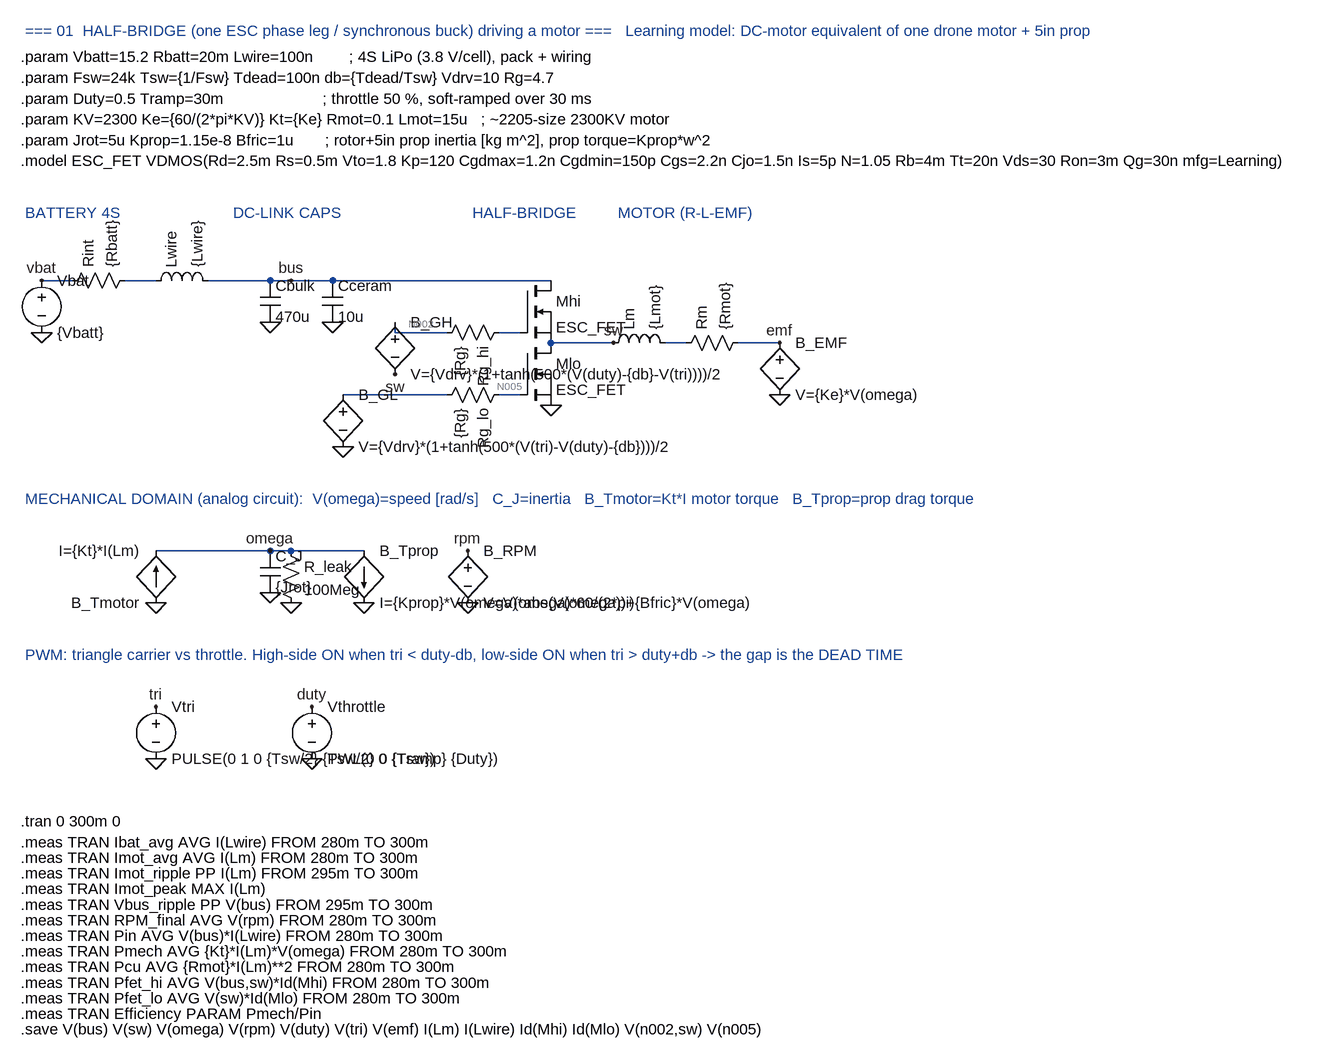
[diagram p0: schematic HalfBridge_MotorDrive.asc]
HalfBridge_MotorDrive.asc, the LTspice schematic file:
Version 4
SHEET 1 1600 1100
WIRE 64 144 112 144
WIRE 192 144 240 144
WIRE 320 144 848 144
WIRE 608 208 608 224
WIRE 608 224 688 224
WIRE 768 224 800 224
WIRE 528 320 688 320
WIRE 768 320 800 320
WIRE 848 240 944 240
WIRE 1024 240 1056 240
WIRE 1136 240 1200 240
WIRE 240 560 560 560
FLAG 64 224 0
FLAG 416 208 0
FLAG 512 208 0
FLAG 848 336 0
FLAG 1200 320 0
FLAG 608 288 sw
FLAG 528 400 0
FLAG 944 240 sw
FLAG 448 144 bus
FLAG 64 144 vbat
FLAG 416 624 0
FLAG 240 640 0
FLAG 560 640 0
FLAG 720 640 0
FLAG 416 560 omega
FLAG 720 560 rpm
FLAG 240 880 0
FLAG 240 800 tri
FLAG 480 880 0
FLAG 480 800 duty
FLAG 1200 240 emf
FLAG 448 640 0
SYMBOL voltage 64 128 R0
SYMATTR InstName Vbat
SYMATTR Value {Vbatt}
SYMBOL res 96 160 R270
SYMATTR InstName Rint
SYMATTR Value {Rbatt}
SYMBOL ind 224 160 R270
SYMATTR InstName Lwire
SYMATTR Value {Lwire}
SYMATTR SpiceLine Rser=2m
SYMBOL cap 400 144 R0
SYMATTR InstName Cbulk
SYMATTR Value 470u
SYMATTR SpiceLine Rser=30m Lser=10n
SYMBOL cap 496 144 R0
SYMATTR InstName Cceram
SYMATTR Value 10u
SYMATTR SpiceLine Rser=2m
SYMBOL nmos 800 144 R0
SYMATTR InstName Mhi
SYMATTR Value ESC_FET
SYMBOL nmos 800 240 R0
SYMATTR InstName Mlo
SYMATTR Value ESC_FET
SYMBOL res 784 208 R90
SYMATTR InstName Rg_hi
SYMATTR Value {Rg}
SYMBOL res 784 304 R90
SYMATTR InstName Rg_lo
SYMATTR Value {Rg}
SYMBOL bv 608 192 R0
SYMATTR InstName B_GH
SYMATTR Value V={Vdrv}*(1+tanh(500*(V(duty)-{db}-V(tri))))/2
SYMBOL bv 528 304 R0
SYMATTR InstName B_GL
SYMATTR Value V={Vdrv}*(1+tanh(500*(V(tri)-V(duty)-{db})))/2
SYMBOL ind 928 256 R270
SYMATTR InstName Lm
SYMATTR Value {Lmot}
SYMBOL res 1040 256 R270
SYMATTR InstName Rm
SYMATTR Value {Rmot}
SYMBOL bv 1200 224 R0
SYMATTR InstName B_EMF
SYMATTR Value V={Ke}*V(omega)
SYMBOL bi 240 640 R180
SYMATTR InstName B_Tmotor
SYMATTR Value I={Kt}*I(Lm)
SYMBOL cap 400 560 R0
SYMATTR InstName C_J
SYMATTR Value {Jrot}
SYMBOL bi 560 560 R0
SYMATTR InstName B_Tprop
SYMATTR Value I={Kprop}*V(omega)*abs(V(omega))+{Bfric}*V(omega)
SYMBOL bv 720 544 R0
SYMATTR InstName B_RPM
SYMATTR Value V=V(omega)*60/(2*pi)
SYMBOL voltage 240 784 R0
SYMATTR InstName Vtri
SYMATTR Value PULSE(0 1 0 {Tsw/2} {Tsw/2} 0 {Tsw})
SYMBOL voltage 480 784 R0
SYMATTR InstName Vthrottle
SYMATTR Value PWL(0 0 {Tramp} {Duty})
TEXT 32 -240 Left 2 ; === 01  HALF-BRIDGE (one ESC phase leg / synchronous buck) driving a motor ===   Learning model: DC-motor equivalent of one drone motor + 5in prop
TEXT 32 -200 Left 2 !.param Vbatt=15.2 Rbatt=20m Lwire=100n        ; 4S LiPo (3.8 V/cell), pack + wiring
TEXT 32 -168 Left 2 !.param Fsw=24k Tsw={1/Fsw} Tdead=100n db={Tdead/Tsw} Vdrv=10 Rg=4.7
TEXT 32 -136 Left 2 !.param Duty=0.5 Tramp=30m                      ; throttle 50 %, soft-ramped over 30 ms
TEXT 32 -104 Left 2 !.param KV=2300 Ke={60/(2*pi*KV)} Kt={Ke} Rmot=0.1 Lmot=15u   ; ~2205-size 2300KV motor
TEXT 32 -72 Left 2 !.param Jrot=5u Kprop=1.15e-8 Bfric=1u       ; rotor+5in prop inertia [kg m^2], prop torque=Kprop*w^2
TEXT 32 -40 Left 2 !.model ESC_FET VDMOS(Rd=2.5m Rs=0.5m Vto=1.8 Kp=120 Cgdmax=1.2n Cgdmin=150p Cgs=2.2n Cjo=1.5n Is=5p N=1.05 Rb=4m Tt=20n Vds=30 Ron=3m Qg=30n mfg=Learning)
TEXT 32 976 Left 2 !.tran 0 300m 0
TEXT 32 1008 Left 2 !.meas TRAN Ibat_avg AVG I(Lwire) FROM 280m TO 300m
TEXT 32 1032 Left 2 !.meas TRAN Imot_avg AVG I(Lm) FROM 280m TO 300m
TEXT 32 1056 Left 2 !.meas TRAN Imot_ripple PP I(Lm) FROM 295m TO 300m
TEXT 32 1080 Left 2 !.meas TRAN Imot_peak MAX I(Lm)
TEXT 32 1104 Left 2 !.meas TRAN Vbus_ripple PP V(bus) FROM 295m TO 300m
TEXT 32 1128 Left 2 !.meas TRAN RPM_final AVG V(rpm) FROM 280m TO 300m
TEXT 32 1152 Left 2 !.meas TRAN Pin AVG V(bus)*I(Lwire) FROM 280m TO 300m
TEXT 32 1176 Left 2 !.meas TRAN Pmech AVG {Kt}*I(Lm)*V(omega) FROM 280m TO 300m
TEXT 32 1200 Left 2 !.meas TRAN Pcu AVG {Rmot}*I(Lm)**2 FROM 280m TO 300m
TEXT 32 1224 Left 2 !.meas TRAN Pfet_hi AVG V(bus,sw)*Id(Mhi) FROM 280m TO 300m
TEXT 32 1248 Left 2 !.meas TRAN Pfet_lo AVG V(sw)*Id(Mlo) FROM 280m TO 300m
TEXT 32 1272 Left 2 !.meas TRAN Efficiency PARAM Pmech/Pin
TEXT 32 480 Left 2 ; MECHANICAL DOMAIN (analog circuit):  V(omega)=speed [rad/s]   C_J=inertia   B_Tmotor=Kt*I motor torque   B_Tprop=prop drag torque
TEXT 32 720 Left 2 ; PWM: triangle carrier vs throttle. High-side ON when tri < duty-db, low-side ON when tri > duty+db -> the gap is the DEAD TIME
TEXT 32 40 Left 2 ; BATTERY 4S
TEXT 352 40 Left 2 ; DC-LINK CAPS
TEXT 720 40 Left 2 ; HALF-BRIDGE
TEXT 944 40 Left 2 ; MOTOR (R-L-EMF)
SYMBOL res 432 544 R0
SYMATTR InstName R_leak
SYMATTR Value 100Meg
TEXT 32 1296 Left 2 !.save V(bus) V(sw) V(omega) V(rpm) V(duty) V(tri) V(emf) I(Lm) I(Lwire) Id(Mhi) Id(Mlo) V(n002,sw) V(n005)

The netlist it stands for:
* HalfBridge_MotorDrive.asc
Vbat vbat 0 {Vbatt}
Rint vbat N001 {Rbatt}
Lwire N001 bus {Lwire} Rser=2m
Cbulk bus 0 470u Rser=30m Lser=10n
Cceram bus 0 10u Rser=2m
Mhi bus N003 sw sw ESC_FET
Mlo sw N005 0 0 ESC_FET
Rg_hi N003 N002 {Rg}
Rg_lo N005 N004 {Rg}
B_GH N002 sw V={Vdrv}*(1+tanh(500*(V(duty)-{db}-V(tri))))/2
B_GL N004 0 V={Vdrv}*(1+tanh(500*(V(tri)-V(duty)-{db})))/2
Lm sw N006 {Lmot}
Rm N006 emf {Rmot}
B_EMF emf 0 V={Ke}*V(omega)
B_Tmotor 0 omega I={Kt}*I(Lm)
C_J omega 0 {Jrot}
B_Tprop omega 0 I={Kprop}*V(omega)*abs(V(omega))+{Bfric}*V(omega)
B_RPM rpm 0 V=V(omega)*60/(2*pi)
Vtri tri 0 PULSE(0 1 0 {Tsw/2} {Tsw/2} 0 {Tsw})
Vthrottle duty 0 PWL(0 0 {Tramp} {Duty})
R_leak omega 0 100Meg
.model NMOS NMOS
.model PMOS PMOS
.lib standard.mos
*  === 01  HALF-BRIDGE (one ESC phase leg / synchronous buck) driving a motor ===   Learning model: DC-motor equivalent of one drone motor + 5in prop
.param Vbatt=15.2 Rbatt=20m Lwire=100n        ; 4S LiPo (3.8 V/cell), pack + wiring
.param Fsw=24k Tsw={1/Fsw} Tdead=100n db={Tdead/Tsw} Vdrv=10 Rg=4.7
.param Duty=0.5 Tramp=30m                      ; throttle 50 %, soft-ramped over 30 ms
.param KV=2300 Ke={60/(2*pi*KV)} Kt={Ke} Rmot=0.1 Lmot=15u   ; ~2205-size 2300KV motor
.param Jrot=5u Kprop=1.15e-8 Bfric=1u       ; rotor+5in prop inertia [kg m^2], prop torque=Kprop*w^2
.model ESC_FET VDMOS(Rd=2.5m Rs=0.5m Vto=1.8 Kp=120 Cgdmax=1.2n Cgdmin=150p Cgs=2.2n Cjo=1.5n Is=5p N=1.05 Rb=4m Tt=20n Vds=30 Ron=3m Qg=30n mfg=Learning)
.tran 0 300m 0
.meas TRAN Ibat_avg AVG I(Lwire) FROM 280m TO 300m
.meas TRAN Imot_avg AVG I(Lm) FROM 280m TO 300m
.meas TRAN Imot_ripple PP I(Lm) FROM 295m TO 300m
.meas TRAN Imot_peak MAX I(Lm)
.meas TRAN Vbus_ripple PP V(bus) FROM 295m TO 300m
.meas TRAN RPM_final AVG V(rpm) FROM 280m TO 300m
.meas TRAN Pin AVG V(bus)*I(Lwire) FROM 280m TO 300m
.meas TRAN Pmech AVG {Kt}*I(Lm)*V(omega) FROM 280m TO 300m
.meas TRAN Pcu AVG {Rmot}*I(Lm)**2 FROM 280m TO 300m
.meas TRAN Pfet_hi AVG V(bus,sw)*Id(Mhi) FROM 280m TO 300m
.meas TRAN Pfet_lo AVG V(sw)*Id(Mlo) FROM 280m TO 300m
.meas TRAN Efficiency PARAM Pmech/Pin
*  MECHANICAL DOMAIN (analog circuit):  V(omega)=speed [rad/s]   C_J=inertia   B_Tmotor=Kt*I motor torque   B_Tprop=prop drag torque
*  PWM: triangle carrier vs throttle. High-side ON when tri < duty-db, low-side ON when tri > duty+db -> the gap is the DEAD TIME
*  BATTERY 4S
*  DC-LINK CAPS
*  HALF-BRIDGE
*  MOTOR (R-L-EMF)
.save V(bus) V(sw) V(omega) V(rpm) V(duty) V(tri) V(emf) I(Lm) I(Lwire) Id(Mhi) Id(Mlo) V(n002,sw) V(n005)
.backanno
.end